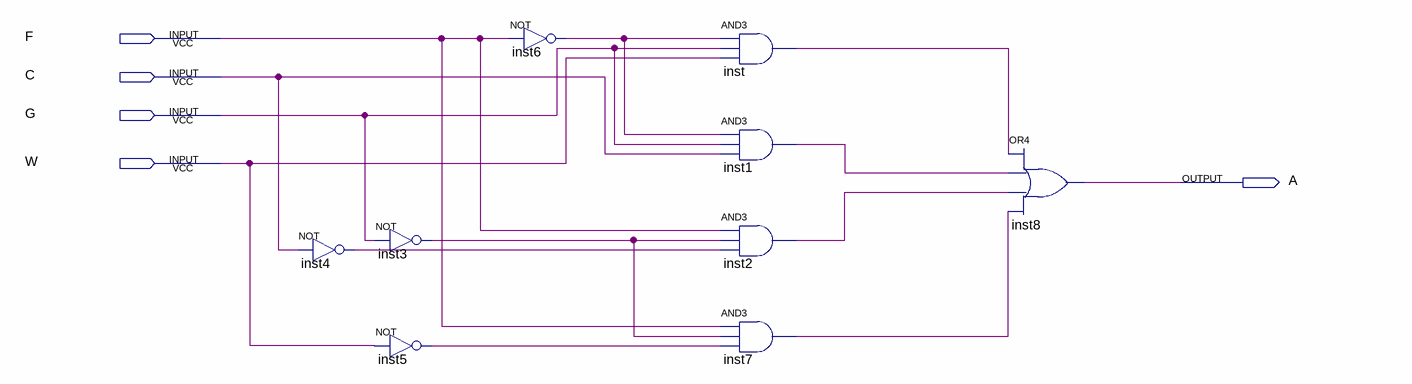
[diagram p0: schematic sheet]
// Quartus schematic Lab03.bdf as structural Verilog: 9 symbols, 5 pins
module Lab03 (
  input  F,
  input  C,
  input  G,
  input  W,
  output A
);

  wire inst1_out, inst2_out, inst3_out, inst4_out, inst5_out, inst6_out, inst7_out, inst_out;

  not inst4 (inst4_out, C);
  not inst3 (inst3_out, G);
  not inst5 (inst5_out, W);
  not inst6 (inst6_out, F);
  and inst (inst_out, inst6_out, G, W);
  and inst1 (inst1_out, inst6_out, G, C);
  and inst2 (inst2_out, F, inst3_out, inst4_out);
  and inst7 (inst7_out, F, inst3_out, inst5_out);
  or inst8 (A, inst_out, inst1_out, inst2_out, inst7_out);
endmodule
